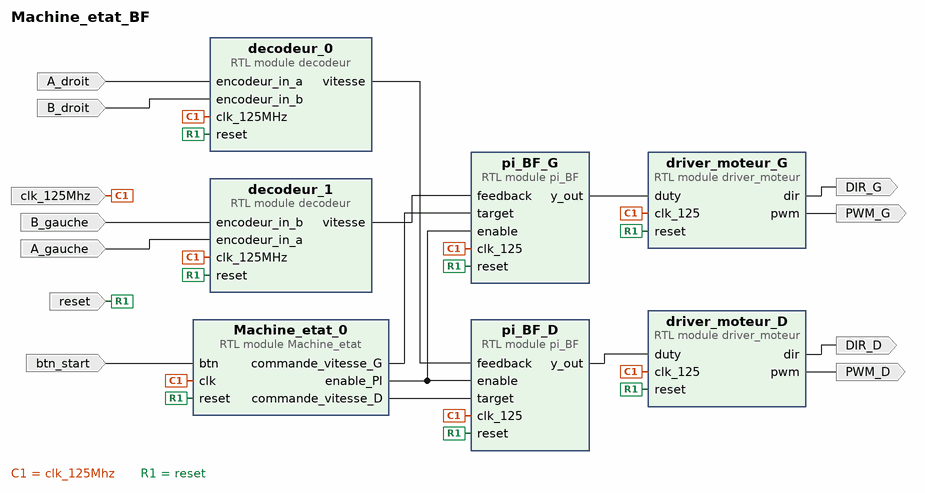
[diagram p0: block diagram of the top level]
# Vivado block design Machine_etat_BF, xc7z020clg400-1, Vivado 2020.2
create_bd_design Machine_etat_BF

create_bd_port -dir O DIR_D
create_bd_port -dir O DIR_G
create_bd_port -dir O PWM_D
create_bd_port -dir O PWM_G
create_bd_port -dir I btn_start
create_bd_port -dir I clk_125Mhz
create_bd_port -dir I reset
create_bd_port -dir I A_gauche
create_bd_port -dir I B_gauche
create_bd_port -dir I A_droit
create_bd_port -dir I B_droit

create_bd_cell -type module -reference driver_moteur driver_moteur_D
create_bd_cell -type module -reference driver_moteur driver_moteur_G
create_bd_cell -type module -reference Machine_etat Machine_etat_0
set_property -dict [list \
  CONFIG.vitesse_rota_D 0 \
  CONFIG.vitesse_rota_G 0 \
  CONFIG.vitesse_trans_D -350 \
  CONFIG.vitesse_trans_G 350 \
] [get_bd_cells Machine_etat_0]
create_bd_cell -type module -reference decodeur decodeur_0
create_bd_cell -type module -reference decodeur decodeur_1
create_bd_cell -type module -reference pi_BF pi_BF_G
set_property -dict {CONFIG.a 5 CONFIG.b 1} [get_bd_cells pi_BF_G]
create_bd_cell -type module -reference pi_BF pi_BF_D
set_property -dict {CONFIG.a 5 CONFIG.b 1} [get_bd_cells pi_BF_D]

# ---- connections ----

connect_bd_net [get_bd_ports btn_start] [get_bd_pins Machine_etat_0/btn]
connect_bd_net [get_bd_ports clk_125Mhz] \
  [get_bd_pins driver_moteur_D/clk_125] [get_bd_pins driver_moteur_G/clk_125] [get_bd_pins Machine_etat_0/clk] \
  [get_bd_pins decodeur_0/clk_125MHz] [get_bd_pins decodeur_1/clk_125MHz] [get_bd_pins pi_BF_G/clk_125] \
  [get_bd_pins pi_BF_D/clk_125]
connect_bd_net [get_bd_pins driver_moteur_D/dir] [get_bd_ports DIR_D]
connect_bd_net [get_bd_pins driver_moteur_D/pwm] [get_bd_ports PWM_D]
connect_bd_net [get_bd_pins driver_moteur_G/dir] [get_bd_ports DIR_G]
connect_bd_net [get_bd_pins driver_moteur_G/pwm] [get_bd_ports PWM_G]
connect_bd_net [get_bd_ports reset] \
  [get_bd_pins driver_moteur_D/reset] [get_bd_pins driver_moteur_G/reset] [get_bd_pins Machine_etat_0/reset] \
  [get_bd_pins decodeur_0/reset] [get_bd_pins decodeur_1/reset] [get_bd_pins pi_BF_G/reset] [get_bd_pins pi_BF_D/reset]
connect_bd_net -net pi_BF_0_y_out [get_bd_pins pi_BF_G/y_out] [get_bd_pins driver_moteur_G/duty]
connect_bd_net -net pi_BF_1_y_out [get_bd_pins pi_BF_D/y_out] [get_bd_pins driver_moteur_D/duty]
connect_bd_net [get_bd_pins Machine_etat_0/commande_vitesse_G] [get_bd_pins pi_BF_G/target]
connect_bd_net [get_bd_pins Machine_etat_0/commande_vitesse_D] [get_bd_pins pi_BF_D/target]
connect_bd_net [get_bd_pins decodeur_1/vitesse] [get_bd_pins pi_BF_G/feedback]
connect_bd_net [get_bd_pins decodeur_0/vitesse] [get_bd_pins pi_BF_D/feedback]
connect_bd_net [get_bd_ports A_droit] [get_bd_pins decodeur_0/encodeur_in_a]
connect_bd_net [get_bd_ports B_droit] [get_bd_pins decodeur_0/encodeur_in_b]
connect_bd_net [get_bd_ports B_gauche] [get_bd_pins decodeur_1/encodeur_in_b]
connect_bd_net [get_bd_ports A_gauche] [get_bd_pins decodeur_1/encodeur_in_a]
connect_bd_net [get_bd_pins Machine_etat_0/enable_PI] [get_bd_pins pi_BF_G/enable] [get_bd_pins pi_BF_D/enable]

validate_bd_design
save_bd_design
